# Altium project NeoLink Basic Main Board.PrjPcb (part 2 of 2)

## Sheet ECG AFE.SchDoc: ECG AFE
size A4; DocumentNumber: 7; SheetNumber: 7; SheetTotal: 9
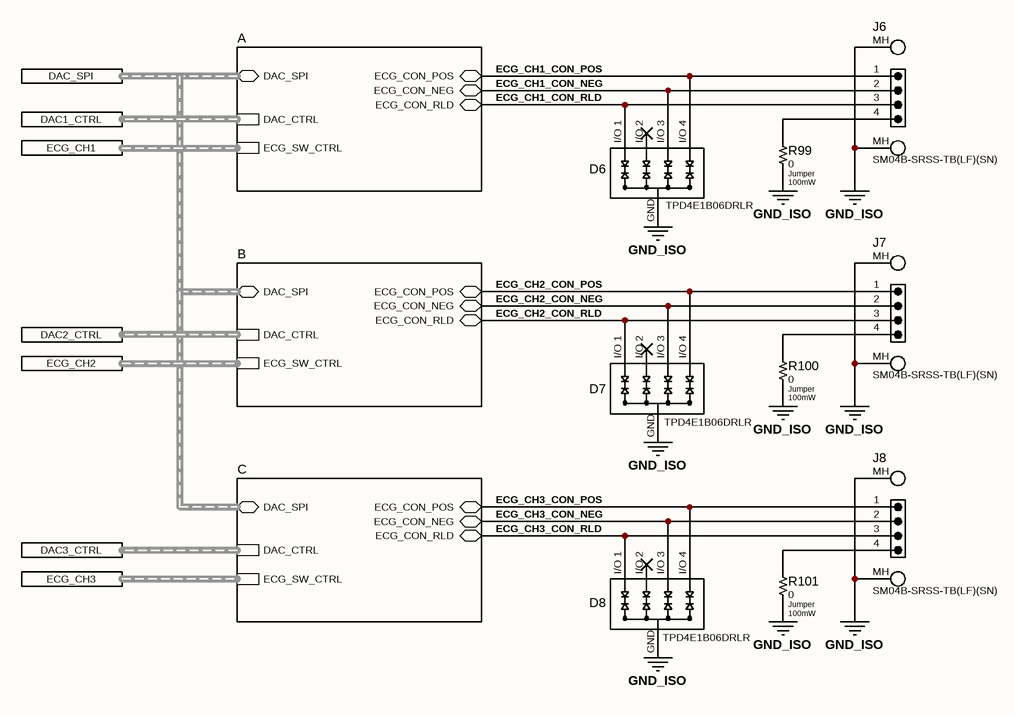
[diagram p9: ECG AFE.SchDoc]

### Parts
D6  TPD4E1B06DRLR  [FP-DRL0006A-MFG]
D7  TPD4E1B06DRLR  [FP-DRL0006A-MFG]
D8  TPD4E1B06DRLR  [FP-DRL0006A-MFG]
J6  SM04B-SRSS-TB(LF)(SN)  [SM04B-SRSS-TB(LF)(SN)]
J7  SM04B-SRSS-TB(LF)(SN)  [SM04B-SRSS-TB(LF)(SN)]
J8  SM04B-SRSS-TB(LF)(SN)  [SM04B-SRSS-TB(LF)(SN)]
R99  0  Tolerance: Jumper  Power: 100mW  [RES-0402-N]
R100  0  Tolerance: Jumper  Power: 100mW  [RES-0402-N]
R101  0  Tolerance: Jumper  Power: 100mW  [RES-0402-N]

### Sub-sheets
A = AFE Channel.SchDoc: DAC_SPI (bidir, harness DAC_SPI), DAC_CTRL (harness DAC_CTRL), ECG_SW_CTRL (harness ECG_SW_CTRL), ECG_CON_POS (bidir), ECG_CON_NEG (bidir), ECG_CON_RLD (bidir)
B = AFE Channel.SchDoc: DAC_SPI (bidir, harness DAC_SPI), DAC_CTRL (harness DAC_CTRL), ECG_SW_CTRL (harness ECG_SW_CTRL), ECG_CON_POS (bidir), ECG_CON_NEG (bidir), ECG_CON_RLD (bidir)
C = AFE Channel.SchDoc: DAC_SPI (bidir, harness DAC_SPI), DAC_CTRL (harness DAC_CTRL), ECG_SW_CTRL (harness ECG_SW_CTRL), ECG_CON_POS (bidir), ECG_CON_NEG (bidir), ECG_CON_RLD (bidir)

### Ports
DAC1_CTRL (harness DAC1_CTRL), DAC2_CTRL (harness DAC1_CTRL), DAC3_CTRL (harness DAC1_CTRL), DAC_SPI (harness DAC_SPI), ECG_CH1 (harness ECG_CH1), ECG_CH2 (harness ECG_CH2), ECG_CH3 (harness ECG_CH3)

### Nets
GND_ISO: D6.2(GND) D7.2(GND) D8.2(GND) J6.MH1(MH) J6.MH2(MH) J7.MH1(MH) J7.MH2(MH) J8.MH1(MH) J8.MH2(MH) R99.2 R100.2 R101.2
ECG_CH1_CON_NEG: D6.4(I/O_3) J6.2 ; sheet A/ECG_CON_NEG
ECG_CH1_CON_POS: D6.6(I/O_4) J6.1 ; sheet A/ECG_CON_POS
ECG_CH1_CON_RLD: D6.1(I/O_1) J6.3 ; sheet A/ECG_CON_RLD
ECG_CH2_CON_NEG: D7.4(I/O_3) J7.2 ; sheet B/ECG_CON_NEG
ECG_CH2_CON_POS: D7.6(I/O_4) J7.1 ; sheet B/ECG_CON_POS
ECG_CH2_CON_RLD: D7.1(I/O_1) J7.3 ; sheet B/ECG_CON_RLD
ECG_CH3_CON_NEG: D8.4(I/O_3) J8.2 ; sheet C/ECG_CON_NEG
ECG_CH3_CON_POS: D8.6(I/O_4) J8.1 ; sheet C/ECG_CON_POS
ECG_CH3_CON_RLD: D8.1(I/O_1) J8.3 ; sheet C/ECG_CON_RLD
NetJ6_4: J6.4 R99.1
NetJ7_4: J7.4 R100.1
NetJ8_4: J8.4 R101.1

Not connected (* = marked no-connect by the designer): D6 3(I/O_2)*; D7 3(I/O_2)*; D8 3(I/O_2)*

### Buses and harness runs
harness port DAC1_CTRL = sheet A/DAC_CTRL
harness port DAC2_CTRL = sheet B/DAC_CTRL
harness port DAC3_CTRL = sheet C/DAC_CTRL
harness port DAC_SPI = sheet A/DAC_SPI = sheet B/DAC_SPI = sheet C/DAC_SPI
harness port ECG_CH1 = sheet A/ECG_SW_CTRL
harness port ECG_CH2 = sheet B/ECG_SW_CTRL
harness port ECG_CH3 = sheet C/ECG_SW_CTRL

### Notes on the sheet
- COMMERCIAL IN CONFIDENCE
- CLIENT
- THIS DOCUMENT IS UNCONTROLLED WHEN PRINTED
- PROJECT
- PART NAME
- TITLE
- SHEET SIZE
- SHEET
- DATE
- A4
- FILE
- PROJECT CODE
- PART / DWG No.
- REV
- VARIANT
- AUTHOR

### Library data of the parts
D6-D8 = CMP-0000003522-1: DIODE-ESD-5.5V-TPD4E1B06DRLR; Manufacturer: Texas Instruments; Voltage - Reverse: 5.5V; Type: ESD Diode Array; Current: N/A; Manufacturer Part Number: TPD4E1B06DRLR; ComponentLink1Description: Datasheet; ComponentLink1URL: https://www.ti.com/general/docs/suppproductinfo.tsp?distId=10&gotoUrl=https%3A%2F%2Fwww.ti.com%2Flit%2Fgpn%2Ftpd4e1b06
J6-J8 = CMP-0000003475-5: CONN-JST-SR/SZ-1x4-SM04B-SRSS-TB(LF)(SN); pin to pad: MH1>5 MH2>6; Manufacturer: JST; ComponentLink1URL: https://au.mouser.com/datasheet/3/1070/1/eSR_SZ.pdf; Manufacturer Part Number: SM04B-SRSS-TB(LF)(SN); Type: Header; ComponentLink1Description: Datasheet
R99-R101 = CMP-0000000811-2: RES-0-0402-JUMPER-100mW; Value: 0

## Sheet AFE Channel.SchDoc: ECG Channel 1
size A2; DocumentNumber: 8; SheetNumber: 8; SheetTotal: 9
Used 3 times, as channels ECG AFE/A, ECG AFE/B, ECG AFE/C. Parts and nets are listed once, with the designators drawn on the sheet.
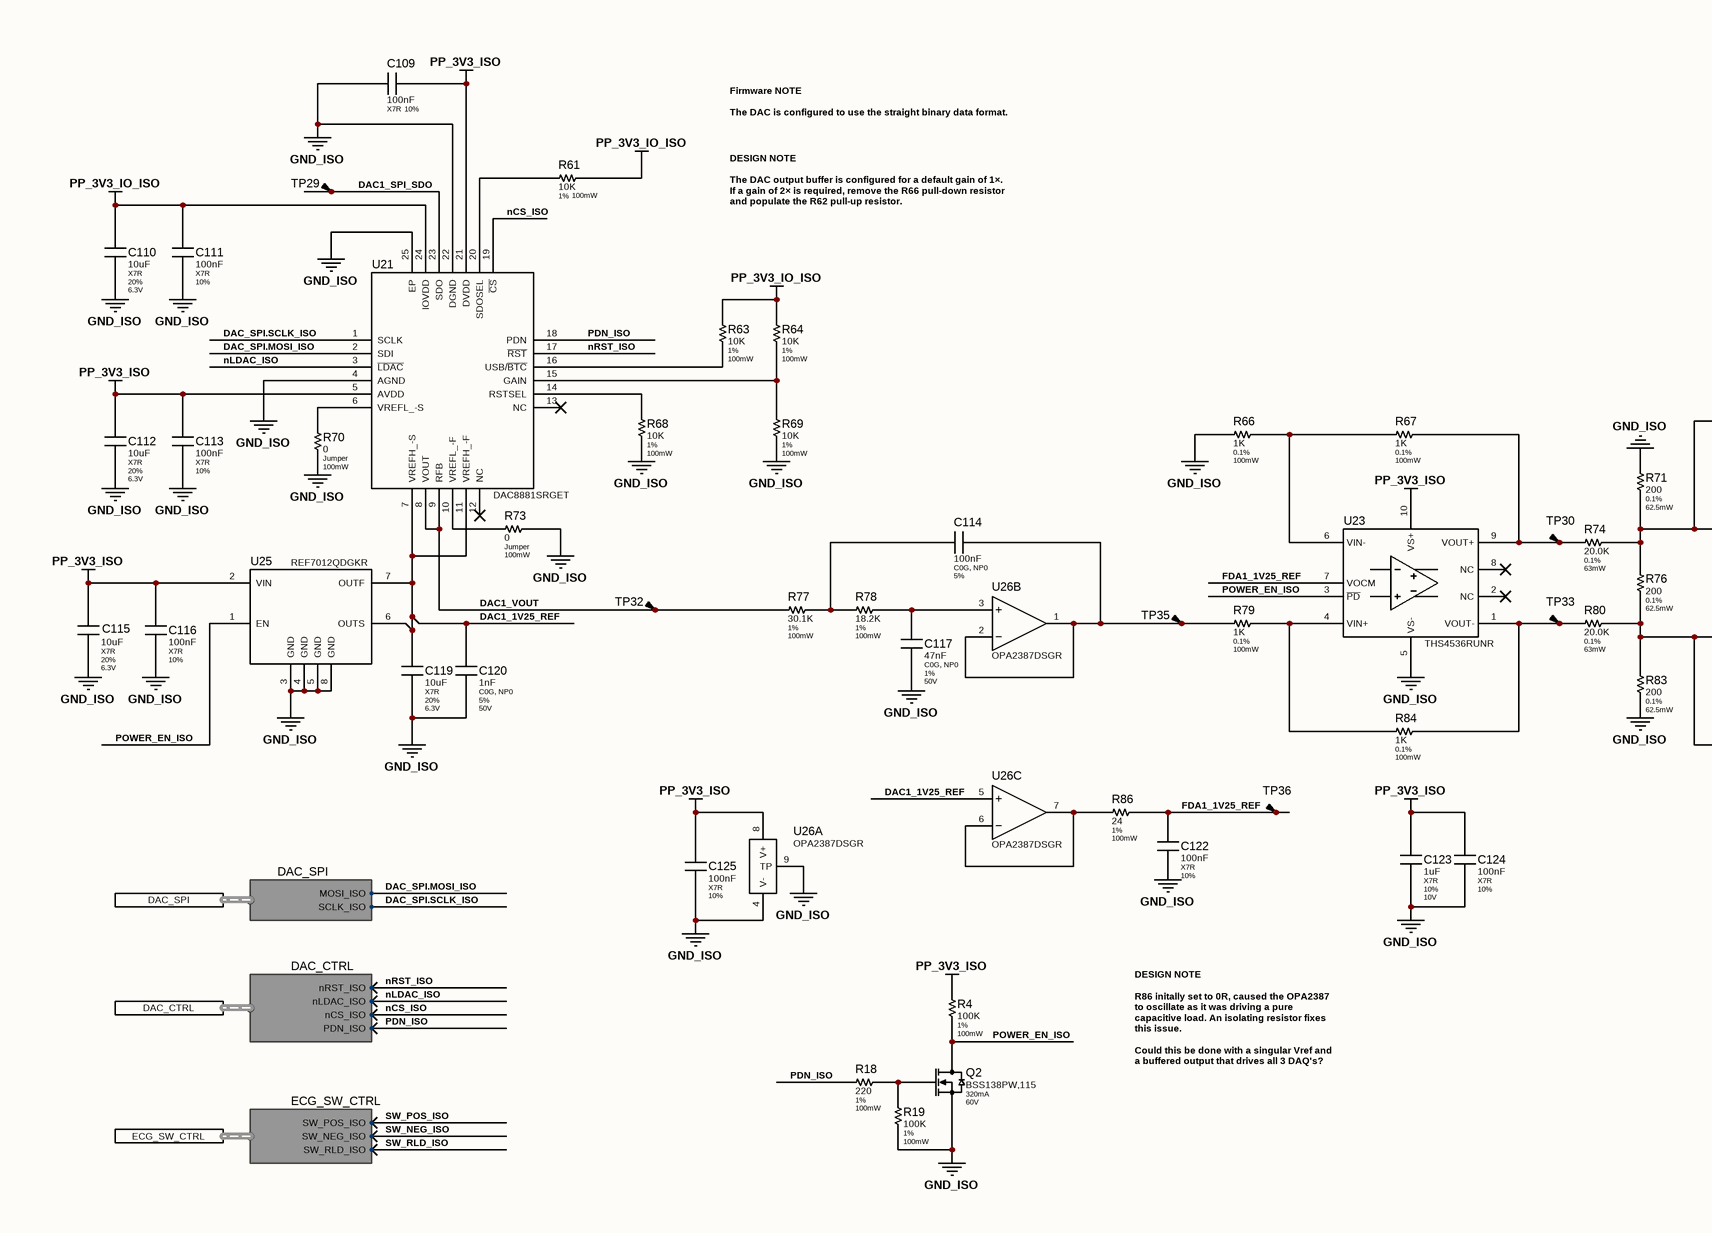
[diagram p10: AFE Channel.SchDoc, left]
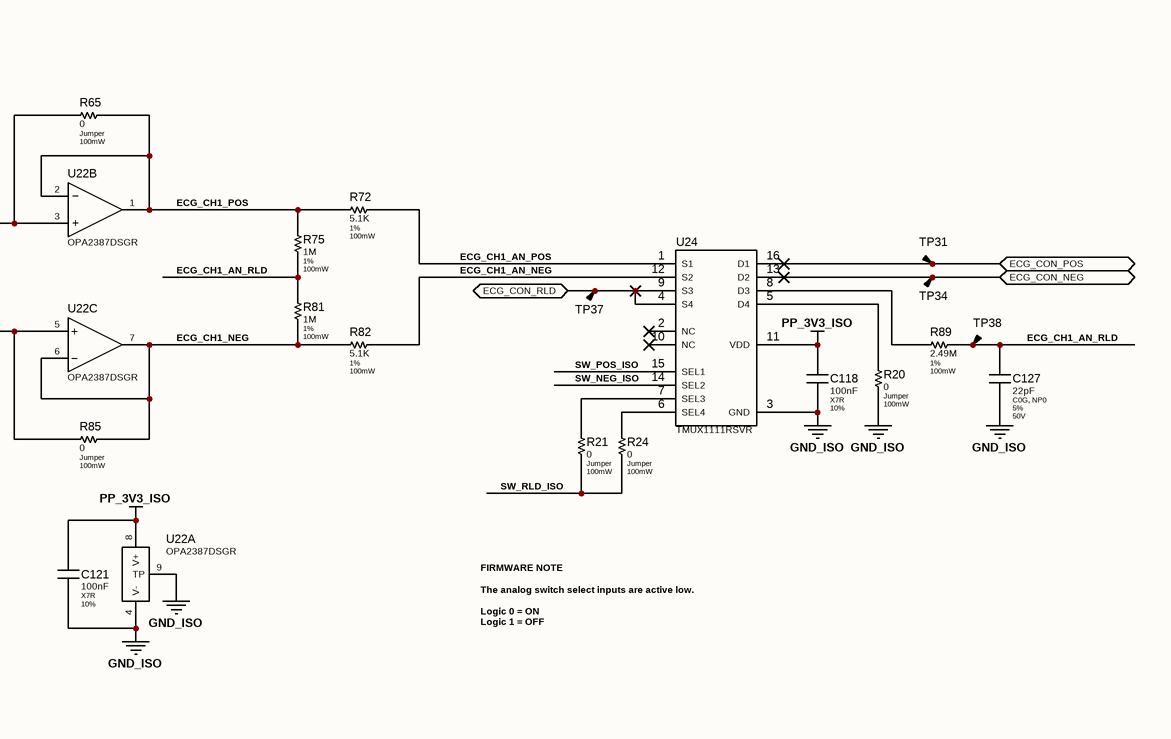
[diagram p11: AFE Channel.SchDoc, right]

### Parts
C109  100nF  Dielectric: X7R  Tolerance: 10%  [MLCC-0402-N]
C110  10uF  Dielectric: X7R  Tolerance: 20%  Voltage: 6.3V  [MLCC-0603-N]
C111  100nF  Dielectric: X7R  Tolerance: 10%  [MLCC-0402-N]
C112  10uF  Dielectric: X7R  Tolerance: 20%  Voltage: 6.3V  [MLCC-0603-N]
C113  100nF  Dielectric: X7R  Tolerance: 10%  [MLCC-0402-N]
C114  100nF  Dielectric: C0G, NP0  Tolerance: 5%  [MLCC-1206-N]
C115  10uF  Dielectric: X7R  Tolerance: 20%  Voltage: 6.3V  [MLCC-0603-N]
C116  100nF  Dielectric: X7R  Tolerance: 10%  [MLCC-0402-N]
C117  47nF  Dielectric: C0G, NP0  Tolerance: 1%  Voltage: 50V  [MLCC-1206-N]
C118  100nF  Dielectric: X7R  Tolerance: 10%  [MLCC-0402-N]
C119  10uF  Dielectric: X7R  Tolerance: 20%  Voltage: 6.3V  [MLCC-0603-N]
C120  1nF  Dielectric: C0G, NP0  Tolerance: 5%  Voltage: 50V  [MLCC-0402-N]
C121  100nF  Dielectric: X7R  Tolerance: 10%  [MLCC-0402-N]
C122  100nF  Dielectric: X7R  Tolerance: 10%  [MLCC-0402-N]
C123  1uF  Dielectric: X7R  Tolerance: 10%  Voltage: 10V  [MLCC-0402-N]
C124  100nF  Dielectric: X7R  Tolerance: 10%  [MLCC-0402-N]
C125  100nF  Dielectric: X7R  Tolerance: 10%  [MLCC-0402-N]
C127  22pF  Dielectric: C0G, NP0  Tolerance: 5%  Voltage: 50V  [MLCC-0402-N]
Q2  BSS138PW,115  Current: 320mA  Voltage: 60V  [SOT-323-N]
R4  100K  Tolerance: 1%  Power: 100mW  [RES-0402-N]
R18  220  Tolerance: 1%  Power: 100mW  [RES-0402-N]
R19  100K  Tolerance: 1%  Power: 100mW  [RES-0402-N]
R20  0  Tolerance: Jumper  Power: 100mW  [RES-0402-N]
R21  0  Tolerance: Jumper  Power: 100mW  [RES-0402-N]
R24  0  Tolerance: Jumper  Power: 100mW  [RES-0402-N]  (no BOM)
R61  10K  Tolerance: 1%  Power: 100mW  [RES-0402-N]
R63  10K  Tolerance: 1%  Power: 100mW  [RES-0402-N]
R64  10K  Tolerance: 1%  Power: 100mW  [RES-0402-N]  (no BOM)
R65  0  Tolerance: Jumper  Power: 100mW  [RES-0402-N]  (no BOM)
R66  1K  Tolerance: 0.1%  Power: 100mW  [RES-0402-N]
R67  1K  Tolerance: 0.1%  Power: 100mW  [RES-0402-N]
R68  10K  Tolerance: 1%  Power: 100mW  [RES-0402-N]
R69  10K  Tolerance: 1%  Power: 100mW  [RES-0402-N]
R70  0  Tolerance: Jumper  Power: 100mW  [RES-0402-N]
R71  200  Tolerance: 0.1%  Power: 62.5mW  [RES-0402-N]
R72  5.1K  Tolerance: 1%  Power: 100mW  [RES-0402-N]
R73  0  Tolerance: Jumper  Power: 100mW  [RES-0402-N]
R74  20.0K  Tolerance: 0.1%  Power: 63mW  [RES-0402-N]
R75  1M  Tolerance: 1%  Power: 100mW  [RES-0402-N]
R76  200  Tolerance: 0.1%  Power: 62.5mW  [RES-0402-N]  (no BOM)
R77  30.1K  Tolerance: 1%  Power: 100mW  [RES-0402-N]
R78  18.2K  Tolerance: 1%  Power: 100mW  [RES-0402-N]
R79  1K  Tolerance: 0.1%  Power: 100mW  [RES-0402-N]
R80  20.0K  Tolerance: 0.1%  Power: 63mW  [RES-0402-N]
R81  1M  Tolerance: 1%  Power: 100mW  [RES-0402-N]
R82  5.1K  Tolerance: 1%  Power: 100mW  [RES-0402-N]
R83  200  Tolerance: 0.1%  Power: 62.5mW  [RES-0402-N]
R84  1K  Tolerance: 0.1%  Power: 100mW  [RES-0402-N]
R85  0  Tolerance: Jumper  Power: 100mW  [RES-0402-N]  (no BOM)
R86  24  Tolerance: 1%  Power: 100mW  [RES-0402-N]
R89  2.49M  Tolerance: 1%  Power: 100mW  [RES-0402-N]
TP29  TP-SMT-CIRCLE  [TP-0.8mm]  (value not drawn)  (no BOM)
TP30  TP-SMT-CIRCLE  [TP-0.8mm]  (value not drawn)  (no BOM)
TP31  TP-SMT-CIRCLE  [TP-0.8mm]  (value not drawn)  (no BOM)
TP32  TP-SMT-CIRCLE  [TP-0.8mm]  (value not drawn)  (no BOM)
TP33  TP-SMT-CIRCLE  [TP-0.8mm]  (value not drawn)  (no BOM)
TP34  TP-SMT-CIRCLE  [TP-0.8mm]  (value not drawn)  (no BOM)
TP35  TP-SMT-CIRCLE  [TP-0.8mm]  (value not drawn)  (no BOM)
TP36  TP-SMT-CIRCLE  [TP-0.8mm]  (value not drawn)  (no BOM)
TP37  TP-SMT-CIRCLE  [TP-0.8mm]  (value not drawn)  (no BOM)
TP38  TP-SMT-CIRCLE  [TP-0.8mm]  (value not drawn)  (no BOM)
U21  DAC8881SRGET  [TI-RGE24-2450X2450TP_V]
U22  OPA2387DSGR  [SON50P200X200X80-9N]  (parts A,B,C of 3)
U23  THS4536RUNR  [THS4536RUNR]
U24  TMUX1111RSVR  [RSV0016A-MFG]
U25  REF7012QDGKR  [FP-DGK0008A-MFG]
U26  OPA2387DSGR  [SON50P200X200X80-9N]  (parts A,B,C of 3)

### Ports
DAC_CTRL (harness DAC_CTRL), DAC_SPI (harness DAC_SPI), ECG_CON_NEG (bidir), ECG_CON_POS (bidir), ECG_CON_RLD (bidir), ECG_SW_CTRL (harness ECG_SW_CTRL)

### Harnesses
DAC_SPI: MOSI_ISO, SCLK_ISO
DAC_CTRL: nLDAC_ISO, nCS_ISO, nRST_ISO, PDN_ISO
ECG_SW_CTRL: SW_NEG_ISO, SW_RLD_ISO, SW_POS_ISO

### Nets
GND_ISO: C109.2 C110.2 C111.2 C112.2 C113.2 C115.2 C116.2 C117.2 C118.2 C119.2 C120.2 C121.2 C122.2 C123.2 C124.2 C125.2 C127.2 Q2.S R19.2 R20.2 R66.1 R68.2 R69.2 R70.2 R71.1 R73.2 R83.2 U21.4(AGND) U21.22(DGND) U21.25(EP) U22.4(V-) U22.9(TP) U23.5(VS-) U24.3(GND) U25.3(GND) U25.4(GND) U25.5(GND) U25.8(GND) U26.4(V-) U26.9(TP)
PP_3V3_IO_ISO: C110.1 C111.1 R61.1 R63.1 R64.1 U21.24(IOVDD)
PP_3V3_ISO: C109.1 C112.1 C113.1 C115.1 C116.1 C118.1 C121.1 C123.1 C124.1 C125.1 R4.1 U21.5(AVDD) U21.21(DVDD) U22.8(V+) U23.10(VS+) U24.11(VDD) U25.2(VIN) U26.8(V+)
DAC1_1V25_REF: C119.1 C120.1 U21.7(VREFH_-S) U21.11(VREFH_-F) U25.6(OUTS) U25.7(OUTF) U26.5(IN2+)
DAC1_SPI_SDO: TP29.1 U21.23(SDO)
DAC1_VOUT: R77.1 TP32.1 U21.8(VOUT) U21.9(RFB)
DAC_SPI.MOSI_ISO: U21.2(SDI) ; port DAC_SPI.MOSI_ISO
DAC_SPI.SCLK_ISO: U21.1(SCLK) ; port DAC_SPI.SCLK_ISO
ECG_CH1_AN_NEG: R82.2 U24.12(S2)
ECG_CH1_AN_POS: R72.2 U24.1(S1)
ECG_CH1_AN_RLD: C127.1 R75.2 R81.2 R89.2 TP38.1
ECG_CH1_NEG: R81.1 R82.1 R85.2 U22.6(IN2-) U22.7(OUT2)
ECG_CH1_POS: R65.2 R72.1 R75.1 U22.1(OUT1) U22.2(IN1-)
ECG_CON_NEG: TP34.1 U24.13(D2) ; port ECG_CON_NEG
ECG_CON_POS: TP31.1 U24.16(D1) ; port ECG_CON_POS
ECG_CON_RLD: TP37.1 U24.4(S4) U24.9(S3) ; port ECG_CON_RLD
FDA1_1V25_REF: C122.1 R86.2 TP36.1 U23.7(VOCM)
nCS_ISO: U21.19(~{CS}) ; port DAC_CTRL.nCS_ISO
nLDAC_ISO: U21.3(~{LDAC}) ; port DAC_CTRL.nLDAC_ISO
nRST_ISO: U21.17(~{RST}) ; port DAC_CTRL.nRST_ISO
PDN_ISO: R18.1 U21.18(PDN) ; port DAC_CTRL.PDN_ISO
POWER_EN_ISO: Q2.D R4.2 U23.3(~{PD}) U25.1(EN)
SW_NEG_ISO: U24.14(SEL2) ; port ECG_SW_CTRL.SW_NEG_ISO
SW_POS_ISO: U24.15(SEL1) ; port ECG_SW_CTRL.SW_POS_ISO
SW_RLD_ISO: R21.2 R24.2 ; port ECG_SW_CTRL.SW_RLD_ISO
NetC114_1: C114.1 R77.2 R78.1
NetC114_2: C114.2 R79.1 TP35.1 U26.1(OUT1) U26.2(IN1-)
NetC117_1: C117.1 R78.2 U26.3(IN1+)
NetQ2_G: Q2.G R18.2 R19.1
NetR20_1: R20.1 U24.5(D4)
NetR21_1: R21.1 U24.7(SEL3)
NetR24_1: R24.1 U24.6(SEL4)
NetR61_2: R61.2 U21.20(SDOSEL)
NetR63_2: R63.2 U21.16(USB/~{BTC})
NetR64_2: R64.2 R69.1 U21.15(GAIN)
NetR65_1: R65.1 R71.2 R74.2 R76.1 U22.3(IN1+)
NetR66_2: R66.2 R67.1 U23.6(VIN-)
NetR67_2: R67.2 R74.1 TP30.1 U23.9(VOUT+)
NetR68_1: R68.1 U21.14(RSTSEL)
NetR70_1: R70.1 U21.6(VREFL_-S)
NetR73_1: R73.1 U21.10(VREFL_-F)
NetR76_2: R76.2 R80.2 R83.1 R85.1 U22.5(IN2+)
NetR79_2: R79.2 R84.1 U23.4(VIN+)
NetR80_1: R80.1 R84.2 TP33.1 U23.1(VOUT-)
NetR86_1: R86.1 U26.6(IN2-) U26.7(OUT2)
NetR89_1: R89.1 U24.8(D3)

Not connected (* = marked no-connect by the designer): U21 12(NC)* 13(NC)*; U23 2(NC)* 8(NC)*; U24 2(NC)* 10(NC)*

### Channels
ECG AFE/A: designators end in A; ports ECG_CON_NEG=ECG_CH1_CON_NEG ECG_CON_POS=ECG_CH1_CON_POS ECG_CON_RLD=ECG_CH1_CON_RLD
ECG AFE/B: designators end in B; ports ECG_CON_NEG=ECG_CH2_CON_NEG ECG_CON_POS=ECG_CH2_CON_POS ECG_CON_RLD=ECG_CH2_CON_RLD
ECG AFE/C: designators end in C; ports ECG_CON_NEG=ECG_CH3_CON_NEG ECG_CON_POS=ECG_CH3_CON_POS ECG_CON_RLD=ECG_CH3_CON_RLD

### Notes on the sheet
- Firmware NOTE
  The DAC is configured to use the straight binary data format.
- DESIGN NOTE
  The DAC output buffer is configured for a default gain of 1×.
  If a gain of 2× is required, remove the R66 pull-down resistor and populate the R62 pull-up resistor.
- FIRMWARE NOTE
  The analog switch select inputs are active low.
  Logic 0 = ON
  Logic 1 = OFF
- DESIGN NOTE
  R86 initally set to 0R, caused the OPA2387 to oscillate as it was driving a pure capacitive load. An isolating resistor fixes this issue.
  Could this be done with a singular Vref and a buffered output that drives all 3 DAQ's?
- THIS DOCUMENT IS UNCONTROLLED WHEN PRINTED
- COMMERCIAL IN CONFIDENCE
- CLIENT
- PROJECT
- PART NAME
- TITLE
- SHEET SIZE
- SHEET
- DATE
- A2
- FILE
- PROJECT CODE
- PART / DWG No.
- REV
- VARIANT
- AUTHOR
- (in symbol CMP-0000003487-3, part B) +; −
- (in symbol CMP-0000003487-3, part C) +; −

### Library data of the parts
C109 C111 C113 C116 C118 C121 C122 C124 C125 = CMP-0000000712-3: CAP-CER-100nF-50V-0402-X7R-10%; Voltage: 50V; Value: 100nF
C110 C112 C115 C119 = CMP-0000000636-4: CAP-CER-10uF-6.3V-0603-X7R-20%; Value: 10uF
C114 = CMP-0000001996-1: CAP-CER-100nF-50V-1206-NP0-5%; Voltage: 50V; Value: 100nF
C117 = CMP-0000002076-1: CAP-CER-47nF-50V-1206-NP0-1%; Value: 47nF
C120 = CMP-0000000731-3: CAP-CER-1nF-50V-0402-NP0-5%; Value: 1nF
C123 = CMP-0000002778-1: CAP-CER-1uF-10V-0402-X7R-10%; Value: 1uF
C127 = CMP-0000000746-3: CAP-CER-22pF-50V-0402-NP0-5%; Value: 22pF
Q2 = CMP-0000002125-8: MOSFET-N-60V-320mA-BSS138PW,115; pin to pad: D>3 G>1 S>2; Manufacturer: Nexperia; Type: N Channel; Rds On: 1.6 Ohms @ Vgs=10V; Manufacturer Part Number: BSS138PW,115; Datasheet: https://assets.nexperia.com/documents/data-sheet/BSS138PW.pdf
R4 R19 = CMP-0000001723-1: RES-100K-0402-1%-100mW; Value: 100K
R18 = CMP-0000001417-1: RES-220-0402-1%-100mW; Value: 220
R20 R21 R24 R65 R70 R73 R85 = CMP-0000000811-2: RES-0-0402-JUMPER-100mW; Value: 0
R61 R63 R64 R68 R69 = CMP-0000001609-1: RES-10K-0402-1%-100mW; Value: 10K
R66 R67 R79 R84 = CMP-0000003492-1: RES-1K-0402-0.1%-100mW; Value: 1K
R71 R76 R83 = CMP-0000003496-1: RES-200-0402-0.1%-62.5mW; Value: 200
R72 R82 = CMP-0000001575-1: RES-5.1K-0402-1%-100mW; Value: 5.1K
R74 R80 = CMP-0000003579-1: RES-20.0K-0402-0.1%-63mW; Value: 20.0K
R75 R81 = CMP-0000001837-2: RES-1M-0402-1%-100mW; Value: 1M
R77 = CMP-0000001662-1: RES-30.1K-0402-1%-100mW; Value: 30.1K
R78 = CMP-0000001637-1: RES-18.2K-0402-1%-100mW; Value: 18.2K
R86 = CMP-0000001308-1: RES-24-0402-1%-100mW; Value: 24
R89 = CMP-0000002849-1: RES-2.49M-0402-1%-100mW; Value: 2.49M
TP29-TP38 = CMP-0000000822-22: Test Point, Circular SMT Style
U21 = CMP-0000003484-2: IC-DAC-DAC8881SRGET; Manufacturer: Texas Instruments; Manufacturer Part Number: DAC8881SRGET; ComponentLink1Description: Datasheet; ComponentLink1URL: https://www.digikey.com/en/products/detail/texas-instruments/DAC8881SRGET/1739759
U22 U26 = CMP-0000003487-3: IC-OPAMP-DUAL-OPA2387DSGR; Manufacturer: Texas Instruments; ComponentLink1Description: Datasheet; ComponentLink1URL: https://www.ti.com/lit/ds/symlink/opa2387.pdf; Manufacturer Part Number: OPA2387DSGR; PartId: 1
U23 = CMP-0000003485-3: IC-DIFFAMP-THS4536RUNR; Manufacturer: Texas Instruments; Manufacturer Part Number: THS4536RUNR; ComponentLink1Description: Datasheet; ComponentLink1URL: https://www.ti.com/lit/ds/symlink/ths4536.pdf
U24 = CMP-0000003515-3: IC-ANALOGSWITCH-TMUX1111RSVR; Manufacturer: Texas Instruments; ComponentLink1Description: Datasheet; Manufacturer Part Number: TMUX1111RSVR; ComponentLink1URL: https://www.ti.com/general/docs/suppproductinfo.tsp?distId=10&gotoUrl=https%3A%2F%2Fwww.ti.com%2Flit%2Fgpn%2Ftmux1111
U25 = CMP-0000003488-2: IC-VREF-1.25V-REF7012QDGKR; Manufacturer: Texas Instruments; ComponentLink1URL: https://www.ti.com/lit/ds/symlink/ref70.pdf; Manufacturer Part Number: REF7012QDGKR; ComponentLink1Description: Datasheet

## Sheet Power Tree.SchDoc: Power Tree
size A4; DocumentNumber: 2; SheetNumber: 2; SheetTotal: 10
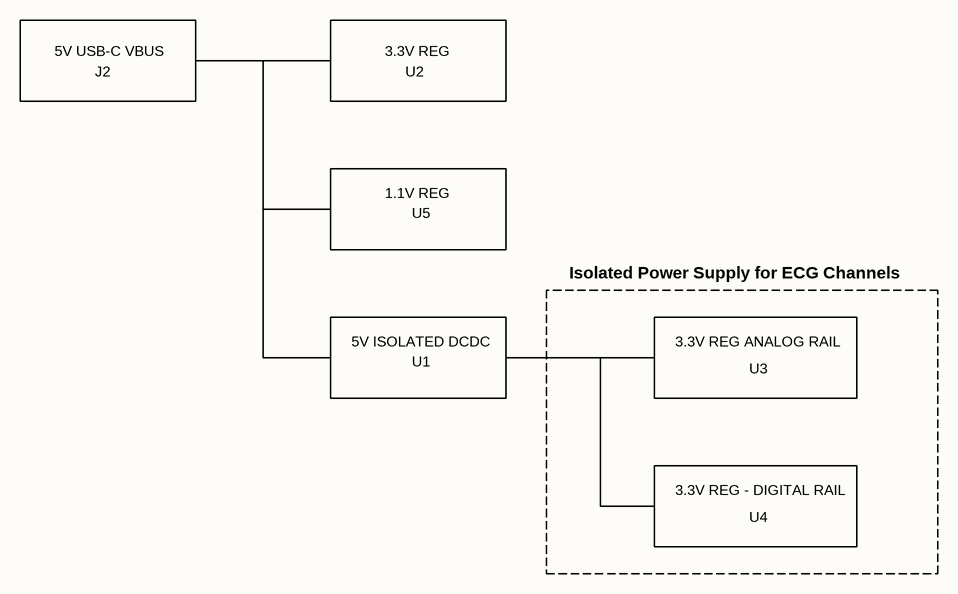
[diagram p12: Power Tree.SchDoc]

### Notes on the sheet
- 5V USB-C VBUS
- 3.3V REG
- J2
- U2
- 1.1V REG
- U5
- Isolated Power Supply for ECG Channels
- 5V ISOLATED DCDC
- U1
- 3.3V REG ANALOG RAIL
- U3
- 3.3V REG - DIGITAL RAIL
- U4
- COMMERCIAL IN CONFIDENCE
- CLIENT
- THIS DOCUMENT IS UNCONTROLLED WHEN PRINTED
- PROJECT
- PART NAME
- TITLE
- SHEET SIZE
- SHEET
- DATE
- A4
- FILE
- PROJECT CODE
- PART / DWG No.
- REV
- VARIANT
- AUTHOR

## Nets that join several sheets
DN2_VBUS: USB 2.0 Hub (C53.1 C57.1 TP16.1 U11.6), USB Ports (FB4.1)
DN3_VBUS: USB 2.0 Hub (C59.1 C61.1 TP19.1 U13.6), USB Ports (FB5.1)
DN4_VBUS: USB 2.0 Hub (C62.1 C64.1 TP22.1 U14.6), USB Ports (FB6.1)
GND: USB 2.0 Hub (70 pins), Power Supply (22 pins), USB Ports (39 pins), MCU (37 pins)
GND_ISO: Power Supply (27 pins), MCU (8 pins), ECG AFE (12 pins), ECG AFE/A (40 pins), ECG AFE/B (40 pins), ECG AFE/C (40 pins)
PP_1V1: USB 2.0 Hub (FB3.2), Power Supply (7 pins)
PP_3V3: USB 2.0 Hub (15 pins), Power Supply (14 pins), USB Ports (R60.1), MCU (27 pins)
PP_3V3_IO_ISO: Power Supply (C21.1 C22.1 TP7.1 U4.5), MCU (8 pins), ECG AFE/A (6 pins), ECG AFE/B (6 pins), ECG AFE/C (6 pins)
PP_3V3_ISO: Power Supply (C14.3 C17.1 C18.1 TP5.1), ECG AFE/A (18 pins), ECG AFE/B (18 pins), ECG AFE/C (18 pins)
PP_5V_VBUS: USB 2.0 Hub (7 pins), Power Supply (7 pins), USB Ports (C104.1 C105.1 TP28.1 U16.1), MCU (C52.1 U6.AD2)
DAC1_CTRL.nCS_ISO: MCU (U7.13), ECG AFE/A (U21A.19)
DAC1_CTRL.nLDAC_ISO: MCU (U7.12), ECG AFE/A (U21A.3)
DAC1_CTRL.nRST_ISO: MCU (U7.11), ECG AFE/A (U21A.17)
DAC1_CTRL.PDN_ISO: MCU (U7.10), ECG AFE/A (R18A.1 U21A.18)
DAC2_CTRL.nCS_ISO: MCU (U8.15), ECG AFE/B (U21B.19)
DAC2_CTRL.nLDAC_ISO: MCU (U8.14), ECG AFE/B (U21B.3)
DAC2_CTRL.nRST_ISO: MCU (U8.13), ECG AFE/B (U21B.17)
DAC2_CTRL.PDN_ISO: MCU (U8.12), ECG AFE/B (R18B.1 U21B.18)
DAC3_CTRL.nCS_ISO: MCU (U8.11), ECG AFE/C (U21C.19)
DAC3_CTRL.nLDAC_ISO: MCU (U8.10), ECG AFE/C (U21C.3)
DAC3_CTRL.nRST_ISO: MCU (U9.15), ECG AFE/C (U21C.17)
DAC3_CTRL.PDN_ISO: MCU (U9.14), ECG AFE/C (R18C.1 U21C.18)
DAC_SPI.MOSI_ISO: MCU (U7.14), ECG AFE/A (U21A.2), ECG AFE/B (U21B.2), ECG AFE/C (U21C.2)
DAC_SPI.SCLK_ISO: MCU (U7.15), ECG AFE/A (U21A.1), ECG AFE/B (U21B.1), ECG AFE/C (U21C.1)
ECG_CH1.SW_NEG_ISO: MCU (U9.12), ECG AFE/A (U24A.14)
ECG_CH1.SW_POS_ISO: MCU (U9.13), ECG AFE/A (U24A.15)
ECG_CH1.SW_RLD_ISO: MCU (U9.11), ECG AFE/A (R21A.2 R24A.2)
ECG_CH1_CON_NEG: ECG AFE (D6.4 J6.2), ECG AFE/A (TP34A.1 U24A.13)
ECG_CH1_CON_POS: ECG AFE (D6.6 J6.1), ECG AFE/A (TP31A.1 U24A.16)
ECG_CH1_CON_RLD: ECG AFE (D6.1 J6.3), ECG AFE/A (TP37A.1 U24A.4 U24A.9)
ECG_CH2.SW_NEG_ISO: MCU (U10.14), ECG AFE/B (U24B.14)
ECG_CH2.SW_POS_ISO: MCU (U10.15), ECG AFE/B (U24B.15)
ECG_CH2.SW_RLD_ISO: MCU (U10.13), ECG AFE/B (R21B.2 R24B.2)
ECG_CH2_CON_NEG: ECG AFE (D7.4 J7.2), ECG AFE/B (TP34B.1 U24B.13)
ECG_CH2_CON_POS: ECG AFE (D7.6 J7.1), ECG AFE/B (TP31B.1 U24B.16)
ECG_CH2_CON_RLD: ECG AFE (D7.1 J7.3), ECG AFE/B (TP37B.1 U24B.4 U24B.9)
ECG_CH3.SW_NEG_ISO: MCU (U10.11), ECG AFE/C (U24C.14)
ECG_CH3.SW_POS_ISO: MCU (U10.12), ECG AFE/C (U24C.15)
ECG_CH3.SW_RLD_ISO: MCU (U10.10), ECG AFE/C (R21C.2 R24C.2)
ECG_CH3_CON_NEG: ECG AFE (D8.4 J8.2), ECG AFE/C (TP34C.1 U24C.13)
ECG_CH3_CON_POS: ECG AFE (D8.6 J8.1), ECG AFE/C (TP31C.1 U24C.16)
ECG_CH3_CON_RLD: ECG AFE (D8.1 J8.3), ECG AFE/C (TP37C.1 U24C.4 U24C.9)
ENABLE_5V_ISO: Power Supply (Q1.G1 R8.2 TP6.1), MCU (U6.B11)
HUB_I2C.SCL: USB 2.0 Hub (R50.2 U12.6 U15.6), MCU (TP12.1 U6.H2)
HUB_I2C.SDA: USB 2.0 Hub (R49.2 U12.5 U15.5), MCU (TP13.1 U6.G1)
USB_DN2.DN_N: USB 2.0 Hub (U12.42), USB Ports (U18.5)
USB_DN2.DN_P: USB 2.0 Hub (U12.41), USB Ports (U18.6)
USB_DN3.DN_N: USB 2.0 Hub (U12.50), USB Ports (U19.5)
USB_DN3.DN_P: USB 2.0 Hub (U12.49), USB Ports (U19.6)
USB_DN4.DN_N: USB 2.0 Hub (U12.57), USB Ports (U20.5)
USB_DN4.DN_P: USB 2.0 Hub (U12.56), USB Ports (U20.6)
USB_nRF.SOC_N: USB 2.0 Hub (U12.34), MCU (U6.AD4)
USB_nRF.SOC_P: USB 2.0 Hub (U12.33), MCU (U6.AD6)
USB_UP.UP_N: USB 2.0 Hub (U12.22), USB Ports (U17.5)
USB_UP.UP_P: USB 2.0 Hub (U12.21), USB Ports (U17.6)
USB_VBUS_FAULT: USB Ports (R60.2 U16.3), MCU (U6.A12)

## Assembly variants
01: not fitted C65 R24A R24B R24C R44 R49 R50 R51 R52 R53 R54 R55 R64A R64B R64C R65A R65B R65C R76A R76B R76C R85A R85B R85C R94 R98 U15